# Altium schematic sheet 48V-ADM32F036A2Q_BLDC_Demo_Rev1.0.schdoc: TopLevel Schematic
size A2; Date: 2019/09/30; Author: SIMON; SheetNumber: 3; SheetTotal: 4; Size: A4; Contact: 0731-88731029; Sheet Title: ADM32; PageSetup: Record=PageOptions?CenterHorizontal=True?CenterVertical=True?PrintScale=0.52?XCorrection=1.00?YCorrection=1.00?PrintKind=0?BorderSize=5000000?LeftOffset=0?BottomOffset=0?Orientation=2?PaperLength=1000?PaperWidth=1000?Scale=100?PaperSource=7?PrintQuality=-4?MediaType=1?DitherType=10?PaperKind=A4?PrintScaleMode=1; ProjectName: ADM32F036A2Q
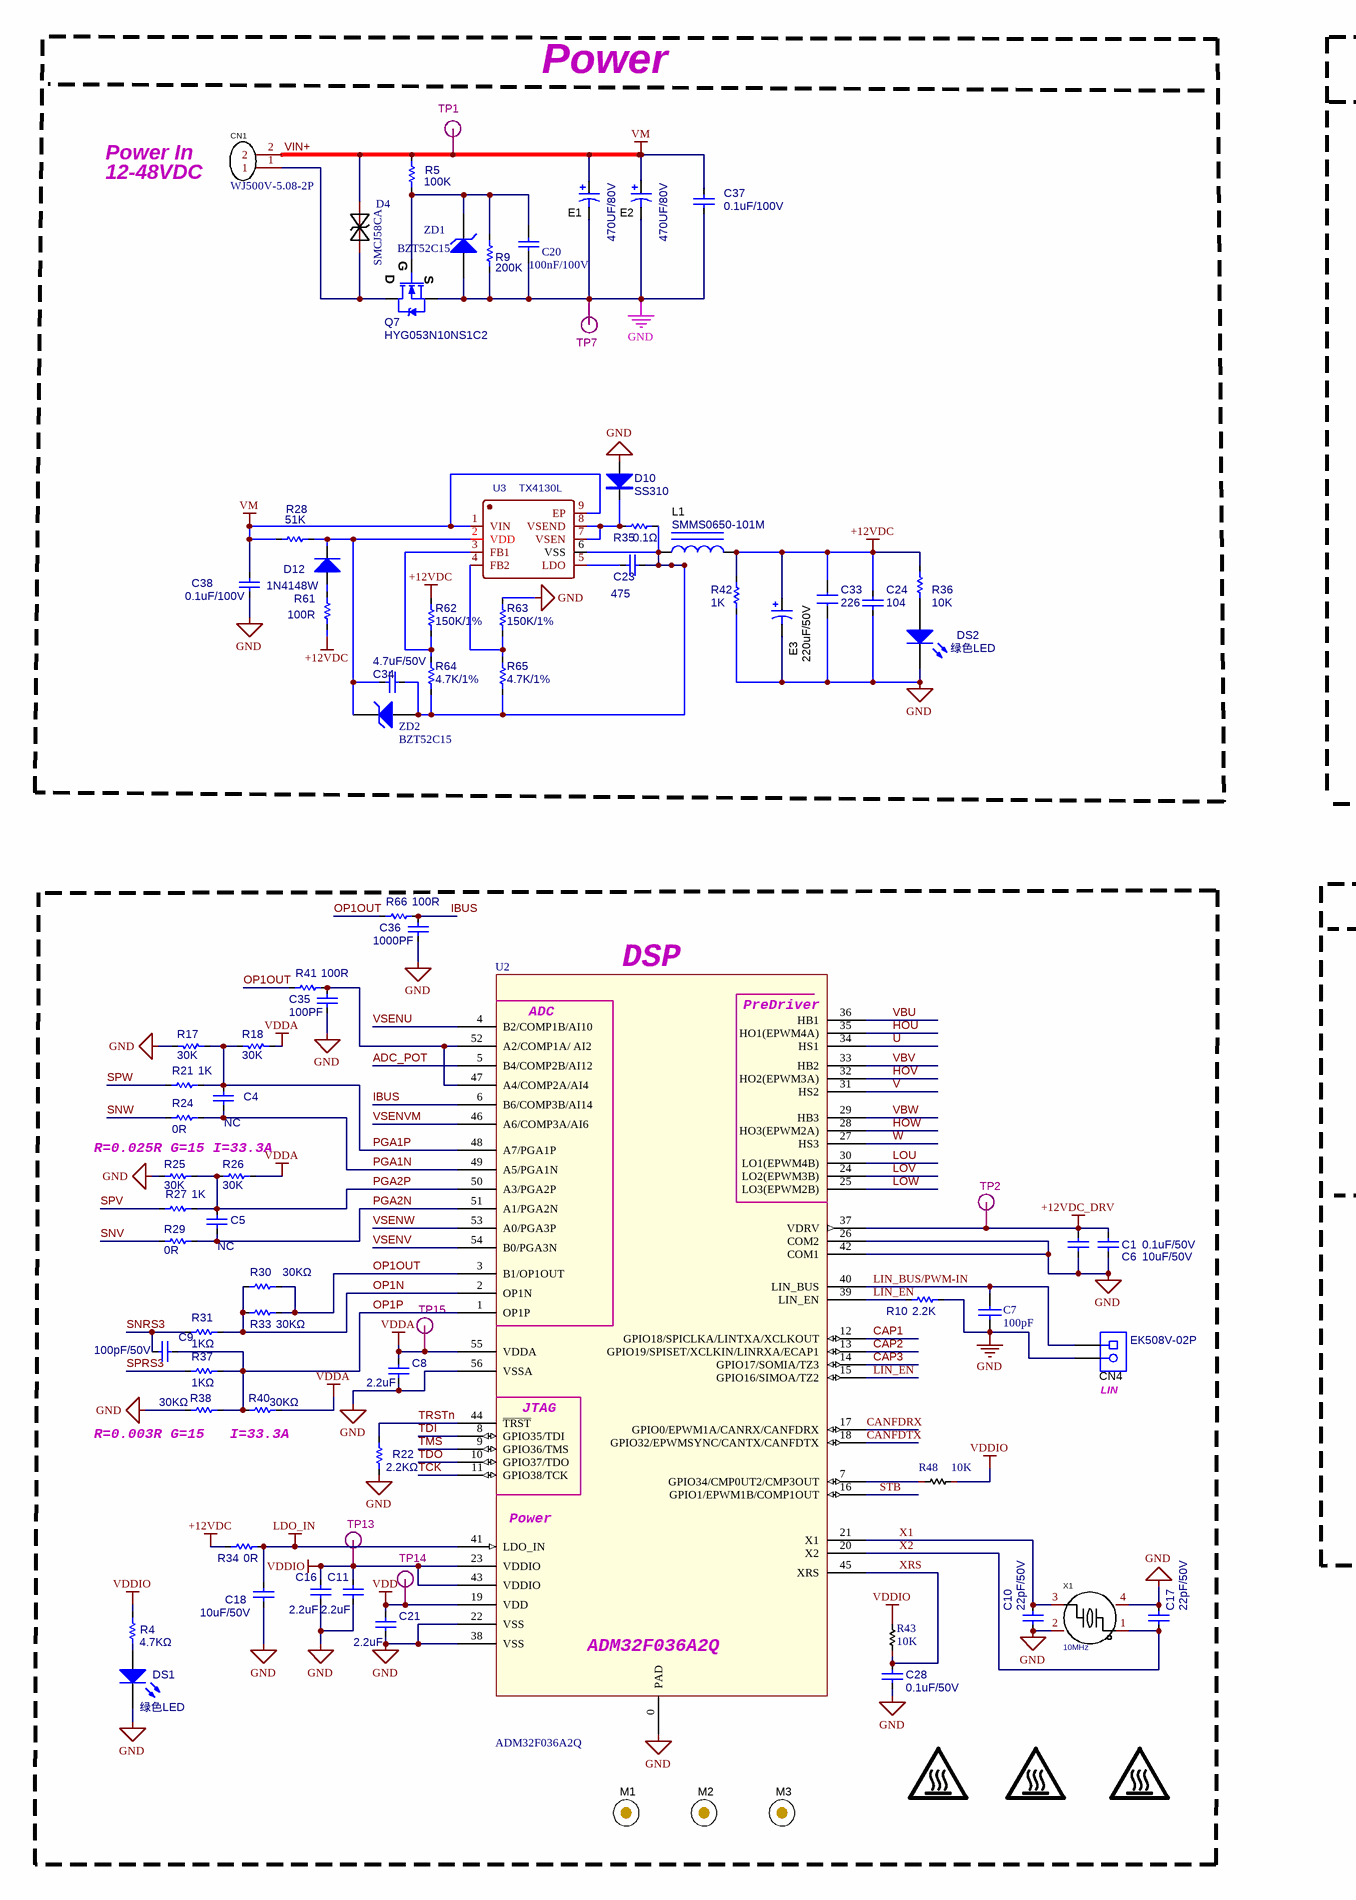
[diagram p0: 48V-ADM32F036A2Q_BLDC_Demo_Rev1.0.schdoc, left]
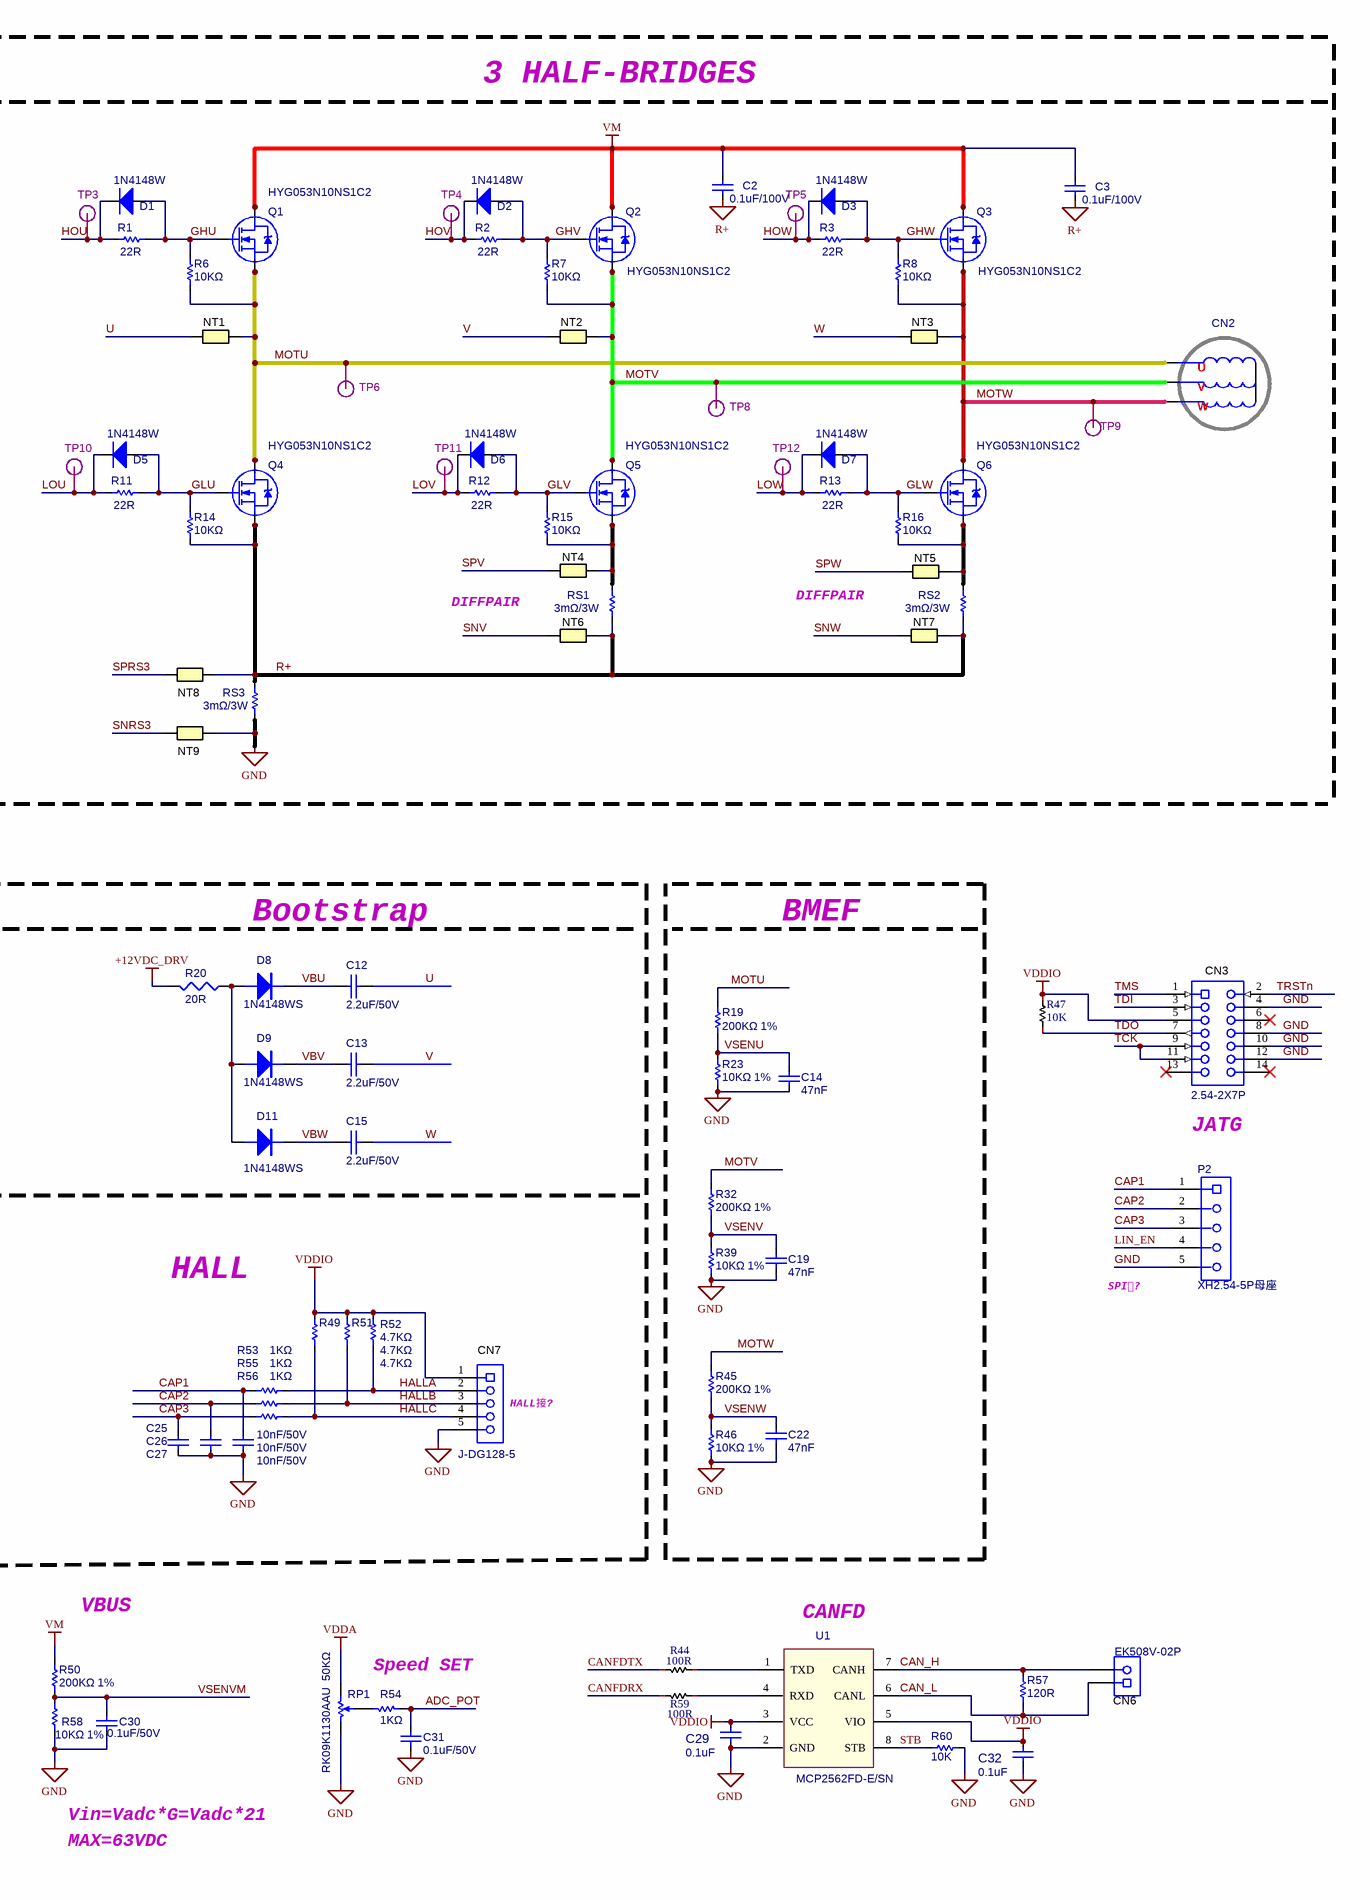
[diagram p1: 48V-ADM32F036A2Q_BLDC_Demo_Rev1.0.schdoc, right]

## Parts
C1  0.1uF/50V  [C0603]
C2  0.1uF/100V  [C1206]
C3  0.1uF/100V  [C1206]
C4  NC  [C0603]
C5  NC  [C0603]
C6  10uF/50V  [C0805]
C7  100pF  [C0603]
C8  value 2.2uF  [C0603]  (hidden comment: 2.2uF/25V)
C9  100pF/50V  [C0603]
C10  22pF/50V  [C0603]
C11  value 2.2uF  [C0603]  (hidden comment: 2.2uF/25V)
C12  2.2uF/50V  [C0805]
C13  2.2uF/50V  [C0805]
C14  value 47nF  [C0603]  (hidden comment: 47nF/25V)
C15  2.2uF/50V  [C0805]
C16  value 2.2uF  [C0603]  (hidden comment: 2.2uF/25V)
C17  22pF/50V  [C0603]
C18  10uF/50V  [C0805]
C19  value 47nF  [C0603]  (hidden comment: 47nF/25V)
C20  100nF/100V  [0603C-X]
C21  value 2.2uF  [C0603]  (hidden comment: 2.2uF/25V)
C22  value 47nF  [C0603]  (hidden comment: 47nF/25V)
C23  475  [0603C-X]
C24  104  [0603C-X]
C25  10nF/50V  [C0603]
C26  10nF/50V  [C0603]
C27  10nF/50V  [C0603]
C28  0.1uF/50V  [C0603]
C29  value 0.1uF  [R0603]  (hidden comment: 0.1uF/50V)
C30  0.1uF/50V  [C0603]
C31  0.1uF/50V  [C0603]
C32  value 0.1uF  [C0603]  (hidden comment: 0.1uF/50V)
C33  226  [1206C-X]
C34  4.7uF/50V  [0603C-X]
C35  100PF  [C0603]
C36  1000PF  [C0603]
C37  0.1uF/100V  [C1206]
C38  0.1uF/100V  [C1206]
CN1  WJ500V-5.08-2P  [J-EK508V-02P]
CN2  EK508V-03P  [J-EK508V-03P]  (value not drawn)
CN3  2.54-2X7P  [IDC14-L]
CN4  EK508V-02P  [J-EK508V-02P]
CN6  EK508V-02P  [J-EK508V-02P]
CN7  J-DG128-5  [DB125-2.54-5P]
D1  1N4148W  [sod-123]
D2  1N4148W  [sod-123]
D3  1N4148W  [sod-123]
D4  SMCJ58CA
D5  1N4148W  [sod-123]
D6  1N4148W  [sod-123]
D7  1N4148W  [sod-123]
D8  1N4148WS  [SOD-323]
D9  1N4148WS  [SOD-323]
D10  SS310  [DIO-SMA-X]
D11  1N4148WS  [SOD-323]
D12  1N4148W  [DIO-SOD123-X]
DS1  绿色LED  [LED0603-RD_RED]
DS2  绿色LED  [LED0603-RD_RED]
E1  470UF/80V  [CAP-TH_BD16.0-P7.50-D1.2-FD]
E2  470UF/80V  [CAP-TH_BD16.0-P7.50-D1.2-FD]
E3  220uF/50V  [CAP-SMD_BD6.3-L6.6-W6.6-LS7.8-FD]
L1  SMMS0650-101M  [IND-SMD_L7.1-W6.6]
LOGO1  CAUTION HOT SURFACE  [IEC_HotSurface_Small]  (value not drawn)  (no BOM)
LOGO2  CAUTION HOT SURFACE  [IEC_HotSurface_Small]  (value not drawn)  (no BOM)
LOGO3  CAUTION HOT SURFACE  [IEC_HotSurface_Small]  (value not drawn)  (no BOM)
M1  (no value)  [Mark1]
M2  (no value)  [Mark1]
M3  (no value)  [Mark1]
NT1  Net-Tie  [Net-Tie_15mil]  (value not drawn)
NT2  Net-Tie  [Net-Tie_15mil]  (value not drawn)
NT3  Net-Tie  [Net-Tie_15mil]  (value not drawn)
NT4  Net-Tie  [Net-Tie_10mil]  (value not drawn)
NT5  Net-Tie  [Net-Tie_10mil]  (value not drawn)
NT6  Net-Tie  [Net-Tie_10mil]  (value not drawn)
NT7  Net-Tie  [Net-Tie_10mil]  (value not drawn)
NT8  Net-Tie  [Net-Tie_10mil]  (value not drawn)
NT9  Net-Tie  [Net-Tie_10mil]  (value not drawn)
P2  XH2.54-5P母座  [SIP5]
Q1  HYG053N10NS1C2  [POWER 56]
Q2  HYG053N10NS1C2  [POWER 56]
Q3  HYG053N10NS1C2  [POWER 56]
Q4  HYG053N10NS1C2  [POWER 56]
Q5  HYG053N10NS1C2  [POWER 56]
Q6  HYG053N10NS1C2  [POWER 56]
Q7  HYG053N10NS1C2  [DFN5*6]
R1  22R  [R0603]
R2  22R  [R0603]
R3  22R  [R0603]
R4  4.7KΩ  [R0603]
R5  100K  [R0603]
R6  10KΩ  [R0603]
R7  10KΩ  [R0603]
R8  10KΩ  [R0603]
R9  200K  [R0603]
R10  2.2K  [R0603]
R11  22R  [R0603]
R12  22R  [R0603]
R13  22R  [R0603]
R14  10KΩ  [R0603]
R15  10KΩ  [R0603]
R16  10KΩ  [R0603]
R17  30K  [R0603]
R18  30K  [R0603]
R19  200KΩ 1%  [R0603]
R20  20R  [R0805]
R21  1K  [R0603]
R22  2.2KΩ  [R0603]
R23  10KΩ 1%  [R0603]
R24  0R  [R0603]
R25  30K  [R0603]
R26  30K  [R0603]
R27  1K  [R0603]
R28  51K  [0603R-X]
R29  0R  [R0603]
R30  30KΩ  [R0603]
R31  1KΩ  [R0603]
R32  200KΩ 1%  [R0603]
R33  30KΩ  [R0603]
R34  0R  [R1206]
R35  0.1Ω  [1206R-X]
R36  10K  [0603R-X]
R37  1KΩ  [R0603]
R38  30KΩ  [R0603]
R39  10KΩ 1%  [R0603]
R40  30KΩ  [R0603]
R41  100R  [R0603]
R42  1K  [0805R-X]
R43  10K  [R0603]
R44  100R  [R0603]
R45  200KΩ 1%  [R0603]
R46  10KΩ 1%  [R0603]
R47  10K  [R0603]
R48  10K  [R0603]
R49  4.7KΩ  [R0603]
R50  200KΩ 1%  [R0603]
R51  4.7KΩ  [R0603]
R52  4.7KΩ  [R0603]
R53  1KΩ  [R0603]
R54  1KΩ  [R0603]
R55  1KΩ  [R0603]
R56  1KΩ  [R0603]
R57  120R  [1206RX]
R58  10KΩ 1%  [R0603]
R59  100R  [R0603]
R60  10K  [R0603]
R61  100R  [0603R-X]
R62  150K/1%  [0603R-X]
R63  150K/1%  [0603R-X]
R64  4.7K/1%  [0603R-X]
R65  4.7K/1%  [0603R-X]
R66  100R  [R0603]
RP1  RK09K1130AAU  50KΩ  [RK09K1130]
RS1  3mΩ/3W  [R2512]
RS2  3mΩ/3W  [R2512]
RS3  3mΩ/3W  [R2512]
TP1  VIN+  [TP-5000-RED]  (value not drawn)
TP2  12V  [TP-5000-RED]  (value not drawn)
TP3  HOU  [TP-5000-RED]  (value not drawn)
TP4  HOV  [TP-5000-RED]  (value not drawn)
TP5  HOW  [TP-5000-RED]  (value not drawn)
TP6  MOTU  [TP-5000-RED]  (value not drawn)
TP7  GND  [TP-5000-RED]  (value not drawn)
TP8  MOTV  [TP-5000-RED]  (value not drawn)
TP9  MOTW  [TP-5000-RED]  (value not drawn)
TP10  LOU  [TP-5000-RED]  (value not drawn)
TP11  LOV  [TP-5000-RED]  (value not drawn)
TP12  LOW  [TP-5000-RED]  (value not drawn)
TP13  VDDIO  [TP-5000-RED]  (value not drawn)
TP14  VDD  [TP-5000-RED]  (value not drawn)
TP15  12V  [TP-5000-RED]  (value not drawn)
U1  MCP2562FD-E/SN  [SO-8]
U2  ADM32F036A2Q  [QFN56-7X7-04P]
U3  TX4130L  [ESOP-8]
X1  10MHz  [XTAL_3225]
ZD1  BZT52C15  [DIO-SOD123-X]
ZD2  BZT52C15  [DIO-SOD123-X]

## Nets
+12VDC: C24.2 C33.2 E3.1(+) L1.2 R34.2 R36.2 R42.1 R61.1 R62.2
+12VDC_DRV: C1.2 C6.1 R20.2 TP2.1 U2.37(VDRV)
GND: C1.1 C6.2 C7.1 C8.2 C10.1 C11.2 C14.1 C16.2 C17.1 C18.2 C19.1 C20.1 C21.2 C22.1 C24.1 C25.1 C26.1 C27.1 C28.1 C29.2 C30.1 C31.1 C32.2 C33.1 C35.2 C36.2 C37.2 C38.2 CN3.4 CN3.8 CN3.10 CN3.12 CN4.2 CN7.5 D10.A DS1.2(K) DS2.2(K) E1.2(-) E2.2(-) E3.2(-) NT9.2 P2.5 Q7.2(S) R9.2 R10.1 R17.1 R22.1 R23.2 R25.1 R38.1 R39.2 R42.2 R46.2 R58.2 R60.1 R63.2 RP1.1 RS3.1 TP7.1 U1.2(GND) U2.0(PAD) U2.22(VSS) U2.26(COM2) U2.38(VSS) U2.42(COM1) U2.56(VSSA) X1.2(GND) X1.4(GND) ZD1.1(A)
LDO_IN: C18.1 R34.1 U2.41(LDO_IN)
R+: C2.2 C3.2 NT6.2 NT7.2 NT8.2 Q4.1(S) Q4.2(S) Q4.3(S) R14.1 RS1.1 RS2.1 RS3.2
VDD: C21.1 TP14.1 U2.19(VDD)
VDDA: C8.1 R18.2 R26.2 R40.2 RP1.3 TP15.1 U2.55(VDDA)
VDDIO: C11.1 C16.1 C29.1 C32.1 CN3.5 CN7.1 R4.1 R43.1 R47.1 R48.2 R49.1 R51.1 R52.1 TP13.1 U1.3(VCC) U1.5(VIO) U2.23(VDDIO) U2.43(VDDIO)
VIN+: C2.1 C3.1 C37.1 C38.1 CN1.2 D4.2 E1.1(+) E2.1(+) Q1.5(D) Q1.6(D) Q1.7(D) Q1.8(D) Q1.9(D) Q2.5(D) Q2.6(D) Q2.7(D) Q2.8(D) Q2.9(D) Q3.5(D) Q3.6(D) Q3.7(D) Q3.8(D) Q3.9(D) R5.1 R28.2 R50.1 TP1.1 U3.1(VIN) U3.9(EP)  [also labelled VM]
ADC_POT: C31.2 R54.2 U2.5(B4/COMP2B/AI12)
CAN_H: CN6.2 R57.2 U1.7(CANH)
CAN_L: CN6.1 R57.1 U1.6(CANL)
CANFDRX: R59.1 U2.17(GPIO0/EPWM1A/CANRX/CANFDRX)
CANFDTX: R44.1 U2.18(GPIO32/EPWMSYNC/CANTX/CANFDTX)
CAP1: C27.2 P2.1 R53.2 U2.12(GPIO18/SPICLKA/LINTXA/XCLKOUT)
CAP2: C26.2 P2.2 R55.2 U2.13(GPIO19/SPISET/XCLKIN/LINRXA/ECAP1)
CAP3: C25.2 P2.3 R56.2 U2.14(GPIO17/SOMIA/TZ3)
GHU: D1.1(A) Q1.4(G) R1.1 R6.2
GHV: D2.1(A) Q2.4(G) R2.1 R7.2
GHW: D3.1(A) Q3.4(G) R3.1 R8.2
GLU: D5.1(A) Q4.4(G) R11.1 R14.2
GLV: D6.1(A) Q5.4(G) R12.1 R15.2
GLW: D7.1(A) Q6.4(G) R13.1 R16.2
HALLA: CN7.2 R52.2 R53.1
HALLB: CN7.3 R51.2 R55.1
HALLC: CN7.4 R49.2 R56.1
HOU: D1.2(K) R1.2 TP3.1 U2.35(HO1(EPWM4A))
HOV: D2.2(K) R2.2 TP4.1 U2.32(HO2(EPWM3A))
HOW: D3.2(K) R3.2 TP5.1 U2.28(HO3(EPWM2A))
IBUS: C36.1 R66.1 U2.6(B6/COMP3B/AI14)
LIN_BUS/PWM-IN: C7.2 CN4.1 U2.40(LIN_BUS)
LIN_EN: P2.4 R10.2 U2.15(GPIO16/SIMOA/TZ2) U2.39(LIN_EN)
LOU: D5.2(K) R11.2 TP10.1 U2.30(LO1(EPWM4B))
LOV: D6.2(K) R12.2 TP11.1 U2.24(LO2(EPWM3B))
LOW: D7.2(K) R13.2 TP12.1 U2.25(LO3(EPWM2B))
MOTU: CN2.1 NT1.2 Q1.1(S) Q1.2(S) Q1.3(S) Q4.5(D) Q4.6(D) Q4.7(D) Q4.8(D) Q4.9(D) R6.1 R19.1 TP6.1
MOTV: CN2.2 NT2.2 Q2.1(S) Q2.2(S) Q2.3(S) Q5.5(D) Q5.6(D) Q5.7(D) Q5.8(D) Q5.9(D) R7.1 R32.1 TP8.1
MOTW: CN2.3 NT3.2 Q3.1(S) Q3.2(S) Q3.3(S) Q6.5(D) Q6.6(D) Q6.7(D) Q6.8(D) Q6.9(D) R8.1 R45.1 TP9.1
OP1N: R30.1 R31.2 R33.2 U2.2(OP1N)
OP1OUT: R30.2 R33.1 R41.2 R66.2 U2.3(B1/OP1OUT)
OP1P: C9.2 R37.2 R38.2 R40.1 U2.1(OP1P)
PGA1N: C4.2 R24.1 U2.49(A5/PGA1N)
PGA1P: C4.1 R17.2 R18.1 R21.1 U2.48(A7/PGA1P)
PGA2N: C5.2 R29.1 U2.51(A1/PGA2N)
PGA2P: C5.1 R25.2 R26.1 R27.1 U2.50(A3/PGA2P)
SNRS3: C9.1 NT9.1 R31.1
SNV: NT6.1 R29.2
SNW: NT7.1 R24.2
SPRS3: NT8.1 R37.1
SPV: NT4.1 R27.2
SPW: NT5.1 R21.2
STB: R60.2 U1.8(STB) U2.16(GPIO1/EPWM1B/COMP1OUT)
TCK: CN3.9 CN3.11 U2.11(GPIO38/TCK)
TDI: CN3.3 U2.8(GPIO35/TDI)
TDO: CN3.7 R47.2 U2.10(GPIO37/TDO)
TMS: CN3.1 U2.9(GPIO36/TMS)
TRSTn: CN3.2 R22.2 U2.44(~{TRST})
U: C12.1 NT1.1 U2.34(HS1)
V: C13.1 NT2.1 U2.31(HS2)
VBU: C12.2 D8.K U2.36(HB1)
VBV: C13.2 D9.K U2.33(HB2)
VBW: C15.2 D11.K U2.29(HB3)
VSENU: C14.2 R19.2 R23.1 U2.4(B2/COMP1B/AI10)
VSENV: C19.2 R32.2 R39.1 U2.54(B0/PGA3N)
VSENVM: C30.2 R50.2 R58.1 U2.46(A6/COMP3A/AI6)
VSENW: C22.2 R45.2 R46.1 U2.53(A0/PGA3P)
W: C15.1 NT3.1 U2.27(HS3)
X1: C10.2 U2.21(X1) X1.3
X2: C17.2 U2.20(X2) X1.1
XRS: C28.2 R43.2 U2.45(XRS)
NetC20_2: C20.2 Q7.1(G) R5.2 R9.1 ZD1.2(K)
NetC23_1: C23.1 C34.2 L1.1 R35.1 R64.1 R65.1 U3.6(VSS) ZD2.1(A)
NetC23_2: C23.2 U3.5(LDO)
NetC34_1: C34.1 D12.2(K) R28.1 U3.2(VDD) ZD2.2(K)
NetC35_1: C35.1 R41.1 U2.47(A4/COMP2A/AI4) U2.52(A2/COMP1A/_AI2)
NetCN1_1: CN1.1 D4.1 Q7.3(D)
NetD8_A: D8.A D9.A D11.A R20.1
NetD10_K: D10.K R35.2 U3.7(VSEN) U3.8(VSEND)
NetD12_1: D12.1(A) R61.2
NetDS1_1: DS1.1(A) R4.2
NetDS2_1: DS2.1(A) R36.1
NetNT4_2: NT4.2 Q5.1(S) Q5.2(S) Q5.3(S) R15.1 RS1.2
NetNT5_2: NT5.2 Q6.1(S) Q6.2(S) Q6.3(S) R16.1 RS2.2
NetR44_2: R44.2 U1.1(TXD)
NetR48_1: R48.1 U2.7(GPIO34/CMP0UT2/CMP3OUT)
NetR54_1: R54.1 RP1.2
NetR59_2: R59.2 U1.4(RXD)
NetR62_1: R62.1 R64.2 U3.3(FB1)
NetR63_1: R63.1 R65.2 U3.4(FB2)

Not connected (* = marked no-connect by the designer): CN3 6* 13* 14*

## Notes on the sheet
- 3 HALF-BRIDGES
- Power
- 12-48VDC
- Power In
- DIFFPAIR
- Bootstrap
- BMEF
- (near U2) DSP
- R=0.025R G=15 I=33.3A
- JATG
- HALL
- SPIͨ?
- (near CN4) LIN
- (near CN7) HALL接?
- R=0.003R G=15   I=33.3A
- VBUS
- (near U1) CANFD
- Speed SET
- Vin=Vadc*G=Vadc*21
- MAX=63VDC
- Sheet Title:
- Project name:
- Size:
- Date:
- Contact:
- Revision:
- Design By:
- Number:
- Sheet       of
- www.advancechip.com
- (in symbol ADM32F036A2Q) PreDriver; ADC; JTAG; Power
- (in symbol Motor2) U; V; W

## Library data of the parts
C1 C23 C24 C28 C31 C34 = Cap: 贴片电容; Value: TDK C3216X7R1V106KT000E; Published: 8-Jun-2000; LatestRevisionDate: 17-Jul-2002; LatestRevisionNote: Re-released for DXP Platform.; Publisher: Altium Limited
C2 C3 C37 C38 = Cap: 贴片电容; Value: 1uF; Published: 8-Jun-2000; LatestRevisionDate: 17-Jul-2002; LatestRevisionNote: Re-released for DXP Platform.; Publisher: Altium Limited
C4-C6 C8 C9 C11 C14 C16 C18 C19 C21 C22 C25-C27 C29 C30 C32 C35 C36 = Cap: 贴片电容; Published: 8-Jun-2000; LatestRevisionDate: 17-Jul-2002; LatestRevisionNote: Re-released for DXP Platform.; Publisher: Altium Limited
  C6: Value: 10uF/50V
C7 = CAP
C10 C17 = Cap: COG贴片电容; Value: 100pF; Published: 8-Jun-2000; LatestRevisionDate: 17-Jul-2002; LatestRevisionNote: Re-released for DXP Platform.; Publisher: Altium Limited
C12 C13 C15 = CAP-C: 贴片电容
C20 = Cap Semi
C33 = CAP: 贴片电容
CN1 = WJ500V-5.08-2P: Symbol: WJ500V-5.08-2P-14-00A; Add into BOM: yes; Structure: 1x2P; Pitch: 5.08mm; Current Rating (Max): 18A; Voltage Rating (Max): 250V; Wire Gauge - AWG: 14~30; Wire Gauge - mm2: 2.5; Number of PINs Per Row: 2; Device: WJ500V-5.08-2P; Supplier: LCSC; Manufacturer Part: WJ500V-5.08-2P; Supplier Part: C8465; JLCPCB Part Class: Extended Part; Datasheet: https://atta.szlcsc.com/upload/public/pdf/source/20191225/C8465_02D34CE5B5B4A53DF5891601D97FA9F4.pdf; Convert to PCB: yes; Number of Pins: 2P; Number of Rows: 1
CN2 = Motor2: 连接器; Published: 24-Mar-1999; LatestRevisionDate: 17-Jul-2002; LatestRevisionNote: Re-released for DXP Platform.; Publisher: Altium Limited
CN3 = Receptacle_7X2: 简易牛角座连接器 卧式; Value: 2.54-2X7P
CN4 CN6 = CON2A: 连接器
CN7 = CMP-0055532-1: 连接器
D1-D3 D5-D7 D12 = M7: 二极管; Published: 8-Jun-2000; LatestRevisionDate: 17-Jul-2002; LatestRevisionNote: Re-released for DXP Platform.; DatasheetDocument: 1998; PackageDocument: Aug-1999; PackageReference: DO-41; Publisher: Altium Limited; Code_JEDEC: DO-204-AL
D4 = SMCJ26CA: Manufact: PAKER(派克微); Symbol: SMCJ26CA_C3012577; Add into BOM: yes; NAME: 2; Pin Type: IN; Device: SMCJ26CA; LCSC Part Name: SMCJ26CA; Supplier Part: C3012577; Manufacturer Part: SMCJ26CA; Supplier Footprint: SMC; JLCPCB Part Class: Extended Part; Datasheet: https://atta.szlcsc.com/upload/public/pdf/source/20220607/6FBEE1574BED151AFE72B096AAF02965.pdf; Supplier: LCSC; Convert to PCB: yes; NUMBER: 2
D8 D9 D11 = 1N4004: 二极管
D10 = DIO: 二极管
DS1 DS2 = LED0: LED; Published: 8-Jun-2000; LatestRevisionDate: 08-Jul-2005; LatestRevisionNote: Mech Layer 1 removed.; PackageReference: LED-0; Publisher: Altium Limited; PackageDescription: LED; 2 Leads
E1 E2 = CMP-0011224-2: ERF1BM471L20OT; PartNumber: EEETP1H102M
E3 = CMP-0011224-2: 贴片电解电容; PartNumber: EEETP1H102M
L1 = CMP-0080995-1: C2894722; AEC Qualified: N; AEC Category: Q200; AEC Grade: N/A
LOGO1-LOGO3 = CMP-0074837-1: IEC 61010-1 Hot Surface Warning; SymbolCreator: a0412235; Lib Reference: IEC_HotSurface; SymbolVersion: 2011-08-22; Published: 2009-03-03; Publisher: Texas Instruments; LatestRevisionDate: 2017-07-06; PartNumber: CAUTION HOT SURFACE; Library Reference: IEC_HotSurface
M1-M3 = CMP-0077181-1: MARK点
NT1-NT9 = CMP-0078142-1: PCB网络短接点; MountType: SMT; PackageReference: N/A; CompType: Net-Tie; Manufacturer: N/A; PartNumber: N/A; Library Reference: Net-Tie
P2 = CON5: 连接器
Q1-Q6 = BSC190N15NS3G: 100V/95A/4.6mΩ; Note: Pin 2 is electrically connected to pin 4.; Published: 8-Jun-2000; LatestRevisionDate: 17-Jul-2002; LatestRevisionNote: Re-released for DXP Platform.; DatasheetDocument: PD-9.814; PackageReference: TO-220AB; Publisher: Altium Limited; Code_JEDEC: TO-220-AB
Q7 = NMOSFET: 100V/95A/4.6mΩ; 替代料: AO3400A  0.7~1.4V; Vth: 0.8~1.5V
R1-R5 R9 R11-R13 R17 R18 R22 R24-R26 R28-R31 R33 R35-R38 R40 R41 R49 R51-R56 R60-R66 = Res: 贴片电阻; Value: 1K; Published: 8-Jun-2000; LatestRevisionDate: 17-Jul-2002; LatestRevisionNote: Re-released for DXP Platform.; Publisher: Altium Limited
R6-R8 R10 R14-R16 R19 R21 R23 R27 R32 R34 R39 R42 R45 R46 R50 R57 R58 = Res: 贴片电阻; Published: 8-Jun-2000; LatestRevisionDate: 17-Jul-2002; LatestRevisionNote: Re-released for DXP Platform.; Publisher: Altium Limited
  R21 R27 R42: Value: 1K
R20 = RES(SMD): 贴片电阻
R43 R47 R48 = 10K/1%: ------; Symbol: Res; Add into BOM: yes; Origin Footprint: 0603R-X; Name: 10K; Device: 10K/1%; Published: 8-Jun-2000; LatestRevisionDate: 17-Jul-2002; LatestRevisionNote: Re-released for DXP Platform.; Publisher: Altium Limited; Convert to PCB: yes; Design Item ID: Res; Library Name: *
R44 R59 = 10K/1%: ------; Name: 1K; Symbol: Res; Add into BOM: yes; Origin Footprint: 0603R-X; Device: 10K/1%; Published: 8-Jun-2000; LatestRevisionDate: 17-Jul-2002; LatestRevisionNote: Re-released for DXP Platform.; Publisher: Altium Limited; Convert to PCB: yes; Design Item ID: Res; Library Name: *
RP1 = RPot SM: 立式可调电位器; Published: 17-Dec-2003; DatasheetDocument: Oct-2003; Publisher: Altium Limited
RS1-RS3 = Res: 贴片采样电阻; Value: 1K; Published: 8-Jun-2000; LatestRevisionDate: 17-Jul-2002; LatestRevisionNote: Re-released for DXP Platform.; Publisher: Altium Limited
TP1-TP15 = TP: 测试点
U1 = SN65H: 3.3V CAN FDͨѶ
U2 = ADM32F036A2Q: 进芯电机驱动专用芯片
U3 = TX4130L: Contributor: LCSC; BOM_Supplier: LCSC; BOM_Supplier Part: C448635; BOM_Manufacturer Part: TX4130L; BOM_JLCPCB Part Class: Extended Part; spicePre: U; spiceSymbolName: TX4130L
X1 = 3TJ410000ZY: 无源晶振; Manufactur: JYJE(晶友嘉); Add into BOM: yes; Crysta: 贴片晶振; Normal temperature Frequency Tolerance: ±10ppm; External load capacitor: 20pF; Frequency Stability(Full temperature range): ±30ppm; Equivalent Series Resistance (ESR): 150Ω; Name: 10MHz; Symbol: 3TJ410000ZYLBC; Device: 3TJ410000ZYLBC; LCSC Part Name: 10MHz ±10ppm 20pF; Supplier Part: C2898998; Manufacturer Part: 3TJ410000ZYLBC; Supplier Footprint: SMD3225-4P; JLCPCB Part Class: Extended Part; Datasheet: https://atta.szlcsc.com/upload/public/pdf/source/20210922/C2898998_79DA4CA19A36528DCEC4420D32E637EE.pdf; Supplier: LCSC; Convert to PCB: yes; Value: 10MHz; Operating Temperature: -40℃~+85℃
ZD1 ZD2 = D Zener: Zener Diode; Published: 8-Jun-2000; LatestRevisionDate: 17-Jul-2002; LatestRevisionNote: Re-released for DXP Platform.; PackageReference: DIODE-0.7; Publisher: Altium Limited; PackageDescription: Diode, Thru-Hole; 2 Leads; 0.7 in Pin Spacing